# Altium schematic sheet USBC_UFP.SchDoc: Skipper USBC UFP
size 297 x 210 mm; Author: Jack Herron; SheetNumber: 7; SheetTotal: 11
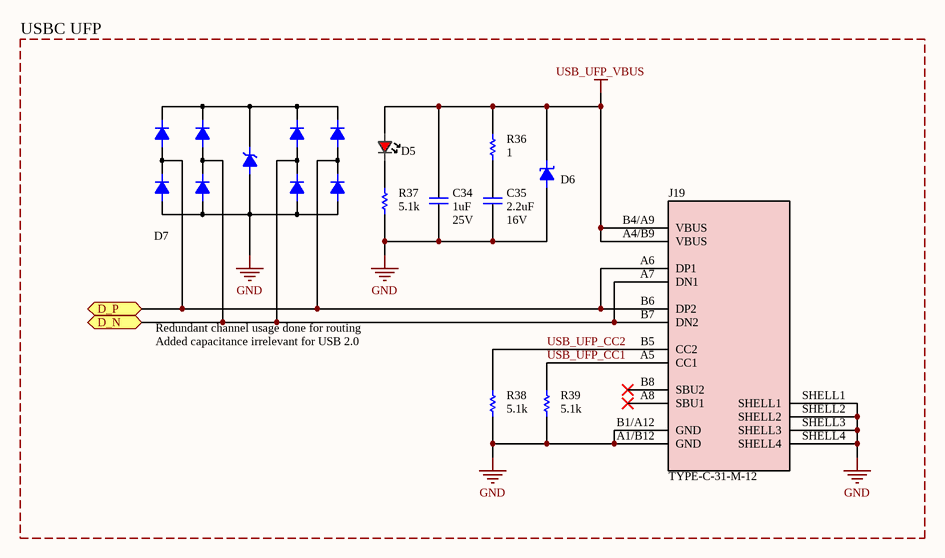
[diagram p0: USBC_UFP.SchDoc]

## Parts
C34  value 1uF  Voltage: 25V  [CAPACITOR-0402]  (hidden comment: CL05A105KA5NQNC)
C35  value 2.2uF  Voltage: 16V  [CAPACITOR-0603]  (hidden comment: CL10A225KO8NNNC)
D5  KT-0603R  [LED-0603]  (value not drawn)
D6  SMF5.0A  [DIODE-SOD-123FL]  (value not drawn)
D7  TPD4E1U06DBVR-TP  [SOT23-6]  (value not drawn)
J19  TYPE-C-31-M-12  [CONNECTOR_USBC_TYPE-C-31-M-12]
R36  value 1  [RESISTOR-0603]  (hidden comment: 0603WAF100KT5E)
R37  value 5.1k  [RESISTOR-0402]  (hidden comment: 0402WGF5101TCE)
R38  value 5.1k  [RESISTOR-0402]  (hidden comment: 0402WGF5101TCE)
R39  value 5.1k  [RESISTOR-0402]  (hidden comment: 0402WGF5101TCE)

## Ports
D_N (bidir, see Top_Sheet[3D]), D_P (bidir, see Top_Sheet[3D])

## Nets
GND: C34.1 C35.1 D6.A D7.2 J19.A1/B12(GND) J19.B1/A12(GND) J19.SHELL1 J19.SHELL2 J19.SHELL3 J19.SHELL4 R37.1 R38.1 R39.1
USB_UFP_VBUS: C34.2 D5.A D6.K J19.A4/B9(VBUS) J19.B4/A9(VBUS) R36.2
D_N: D7.3 D7.4 J19.A7(DN1) J19.B7(DN2) ; port D_N
D_P: D7.1 D7.6 J19.A6(DP1) J19.B6(DP2) ; port D_P
USB_UFP_CC1: J19.A5(CC1) R39.2
USB_UFP_CC2: J19.B5(CC2) R38.2
NetC35_2: C35.2 R36.1
NetD5_K: D5.K R37.2

Not connected (* = marked no-connect by the designer): J19 A8(SBU1)* B8(SBU2)*

## Notes on the sheet
- USBC UFP
- Redundant channel usage done for routing
- Added capacitance irrelevant for USB 2.0
- Title:
- File:
- Date:
- Project:
- Author:

## Library data of the parts
C34 = CAPACITOR_CL05A105KA5NQNC: Capacitor - 1uF - 25V - 0402 - X5R; Manufacturer 1: Samsung; Manufacturer Part Number 1: CL05A105KA5NQNC; Supplier 1: LCSC; Supplier Part Number 1: C52923
C35 = CAPACITOR_CL10A225KO8NNNC: Capacitor - 2.2uF - 16V - 0603 - X5R; Manufacturer 1: Samsung; Manufacturer Part Number 1: CL10A225KO8NNNC; Supplier 1: LCSC; Supplier Part Number 1: C23630
D5 = LED_KT-0603R: LED - Red - 0603; Manufacturer 1: Hubei KENTO Elec; Manufacturer Part Number 1: KT-0603R; Supplier 1: LCSC; Supplier Part Number 1: C2286
D6 = DIODE_TVS_UNIDIRECTIONAL_5-7-9.2V_SMF5.0A: TVS Diode 5V standoff, 7V breakdown, 9.2V clamp; Manufacturer 1: Littelfuse; Manufacturer Part Number 1: SMF5.0A; Supplier 1: LCSC; Supplier Part Number 1: C151296
D7 = ESD-ARRAY_4-Channel_TPD4E1U06DBVR-TP: Diode - TVS - USB ESD Protection - SOT23-6; Manufacturer 1: Tech Public; Manufacturer Part Number 1: TPD4E1U06DBVR-TP; Supplier 1: LCSC; Supplier Part Number 1: C2841427
J19 = CONNECTOR_USBC_TYPE-C-31-M-12: USB Recepticle - Type-C; Manufacturer 1: Korean Hroparts Elec; Manufacturer Part Number 1: TYPE-C-31-M-12; Supplier 1: LCSC; Supplier Part Number 1: C165948
R36 = RESISTOR_0603WAF100KT5E: Resistor - 1 - 0603; Manufacturer 1: UNI-ROYAL; Voltage: 75V; Wattage: 100mW; Manufacturer Part Number 1: 0603WAF100KT5E; Supplier 1: LCSC; Supplier Part Number 1: C22936
R37-R39 = RESISTOR_0402WGF5101TCE: Resistor - 5.1k - 0402; Manufacturer 1: UNI-ROYAL; Voltage: 50V; Wattage: 62.5mW; Manufacturer Part Number 1: 0402WGF5101TCE; Supplier 1: LCSC; Supplier Part Number 1: C25905